# Altium schematic sheet type_A_output.SchDoc
size A; SheetNumber: 4; SheetTotal: 4
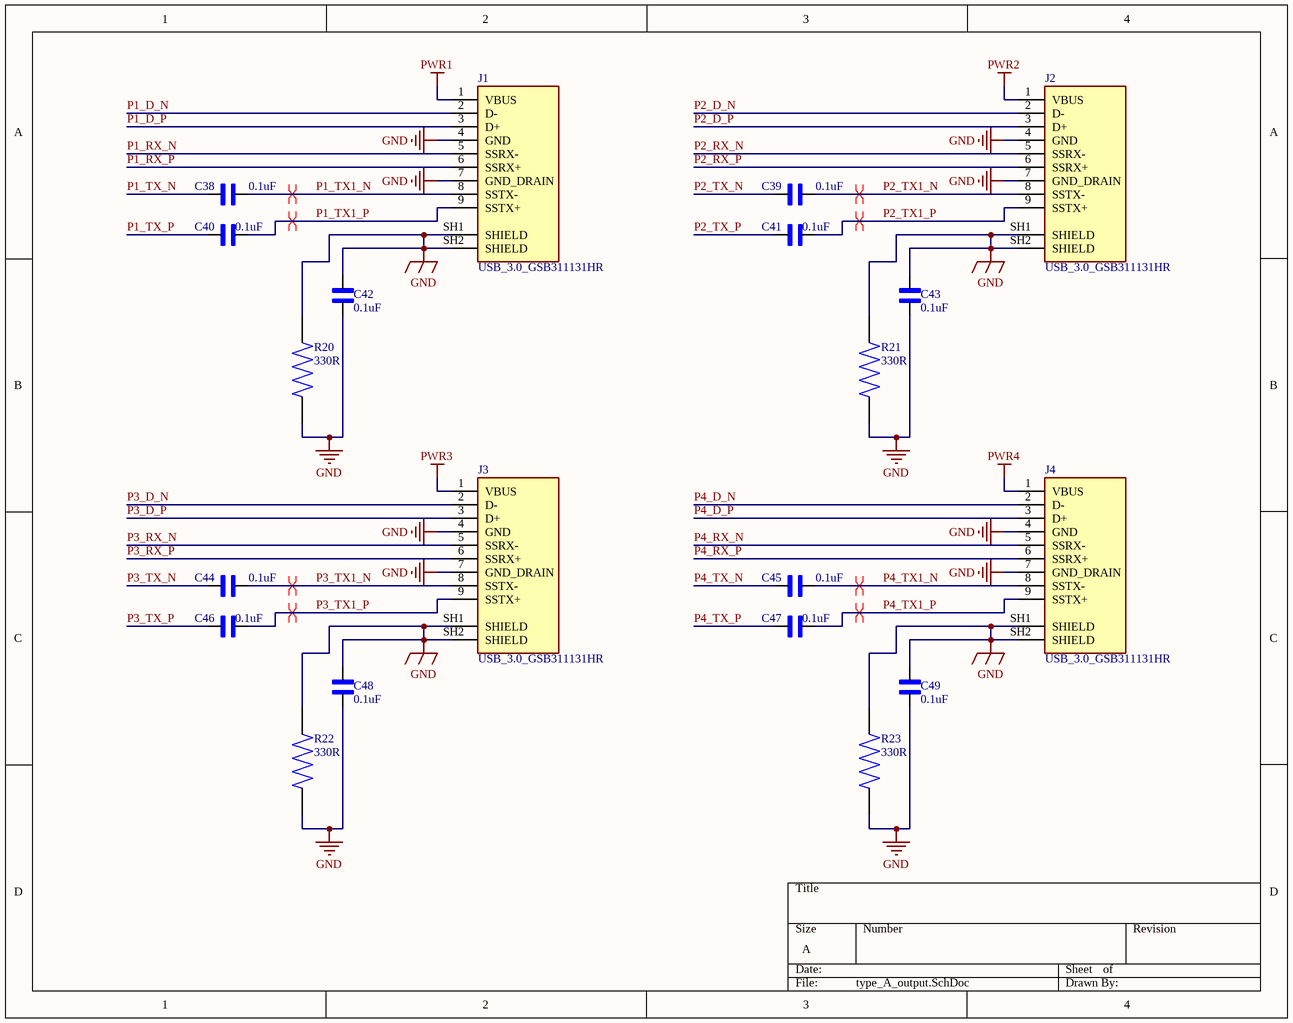
[diagram p0: type_A_output.SchDoc]

## Parts
C38  0.1uF  [CAPC1608X94N]
C39  0.1uF  [CAPC1608X94N]
C40  0.1uF  [CAPC1608X94N]
C41  0.1uF  [CAPC1608X94N]
C42  0.1uF  [CAPC1608X94N]
C43  0.1uF  [CAPC1608X94N]
C44  0.1uF  [CAPC1608X94N]
C45  0.1uF  [CAPC1608X94N]
C46  0.1uF  [CAPC1608X94N]
C47  0.1uF  [CAPC1608X94N]
C48  0.1uF  [CAPC1608X94N]
C49  0.1uF  [CAPC1608X94N]
J1  USB_3.0_GSB311131HR  [USB 3.0]
J2  USB_3.0_GSB311131HR  [USB 3.0]
J3  USB_3.0_GSB311131HR  [USB 3.0]
J4  USB_3.0_GSB311131HR  [USB 3.0]
R20  330R  [RES_ERJU03J474V]
R21  330R  [RES_ERJU03J474V]
R22  330R  [RES_ERJU03J474V]
R23  330R  [RES_ERJU03J474V]

## Nets
GND: C42.1 C42.2 C43.1 C43.2 C48.1 C48.2 C49.1 C49.2 J1.4(GND) J1.7(GND_DRAIN) J1.SH1(SHIELD) J1.SH2(SHIELD) J2.4(GND) J2.7(GND_DRAIN) J2.SH1(SHIELD) J2.SH2(SHIELD) J3.4(GND) J3.7(GND_DRAIN) J3.SH1(SHIELD) J3.SH2(SHIELD) J4.4(GND) J4.7(GND_DRAIN) J4.SH1(SHIELD) J4.SH2(SHIELD) R20.1 R20.2 R21.1 R21.2 R22.1 R22.2 R23.1 R23.2
PWR1: J1.1(VBUS)
PWR2: J2.1(VBUS)
PWR3: J3.1(VBUS)
PWR4: J4.1(VBUS)
P1_D_N: J1.2(D-)
P1_D_P: J1.3(D+)
P1_RX_N: J1.5(SSRX-)
P1_RX_P: J1.6(SSRX+)
P1_TX1_N: C38.2 J1.8(SSTX-)
P1_TX1_P: C40.2 J1.9(SSTX+)
P1_TX_N: C38.1
P1_TX_P: C40.1
P2_D_N: J2.2(D-)
P2_D_P: J2.3(D+)
P2_RX_N: J2.5(SSRX-)
P2_RX_P: J2.6(SSRX+)
P2_TX1_N: C39.2 J2.8(SSTX-)
P2_TX1_P: C41.2 J2.9(SSTX+)
P2_TX_N: C39.1
P2_TX_P: C41.1
P3_D_N: J3.2(D-)
P3_D_P: J3.3(D+)
P3_RX_N: J3.5(SSRX-)
P3_RX_P: J3.6(SSRX+)
P3_TX1_N: C44.2 J3.8(SSTX-)
P3_TX1_P: C46.2 J3.9(SSTX+)
P3_TX_N: C44.1
P3_TX_P: C46.1
P4_D_N: J4.2(D-)
P4_D_P: J4.3(D+)
P4_RX_N: J4.5(SSRX-)
P4_RX_P: J4.6(SSRX+)
P4_TX1_N: C45.2 J4.8(SSTX-)
P4_TX1_P: C47.2 J4.9(SSTX+)
P4_TX_N: C45.1
P4_TX_P: C47.1

## Layout directives
differential pair: P1_TX1_N, P1_TX1_P, P2_TX1_N, P2_TX1_P, P3_TX1_N, P3_TX1_P, P4_TX1_N, P4_TX1_P

## Library data of the parts
C38-C49 = cap_0603_VJ0603D3R9DXCAP: cap 0603 (1608 Metric); MF: Vishay Vitramon; SnapEDA_Link: https://www.snapeda.com/parts/VJ0603D3R9DXCAP/Vishay/view-part/?ref=snap; Package: 1608 Vishay Vitramon; Value: *; MP: VJ0603D3R9DXCAP; Check_prices: https://www.snapeda.com/parts/VJ0603D3R9DXCAP/Vishay/view-part/?ref=eda
J1-J4 = USB_3.0_GSB311131HR: USB-A _USB TYPE-A_ USB 3.0 _USB 3.1 Gen 1, Superspeed_ Receptacle Connector 9 Position Through Hole, Right Angle / GSB311131HR; MF: Amphenol ICC; Package: None; Digi-Key_Purchase_URL: https://www.digikey.ru/product-detail/en/amphenol-icc-commercial-products/GSB311131HR/GSB311131HR-ND/2187173?utm_source=snapeda&utm_medium=aggregator&utm_campaign=symbol; Value: *; MP: GSB311131HR; SnapEDA_Link: https://www.snapeda.com/parts/GSB311131HR/Amphenol%20FCI/view-part/229215/?ref=snap; Digi-Key_Part_Number: GSB311131HR-ND
R20-R23 = res_0603_ERJU03J474V: 0603 Anti-Sulfurated; MF: Panasonic; SnapEDA_Link: https://www.snapeda.com/parts/ERJU03J474V/Panasonic/view-part/?ref=snap; Package: 1608-2 Panasonic; Value: *; MP: ERJU03J474V; Check_prices: https://www.snapeda.com/parts/ERJU03J474V/Panasonic/view-part/?ref=eda